# Altium schematic sheet LINREG.SchDoc: Linear Voltage Regulators
size A4; ApprovedBy: LD Stanton; Author: LD Stanton; CompanyName: University of Cape Town; DrawnBy: Lawrence Stanton; Engineer: Lawrence Stanton; Organization: University of Cape Town; Address1: Department of Electrical Engineering; Address2: Rondebosch; Address3: Cape Town; Address4: South Africa 7701; DocumentNumber: 4; SheetNumber: 4; SheetTotal: 14
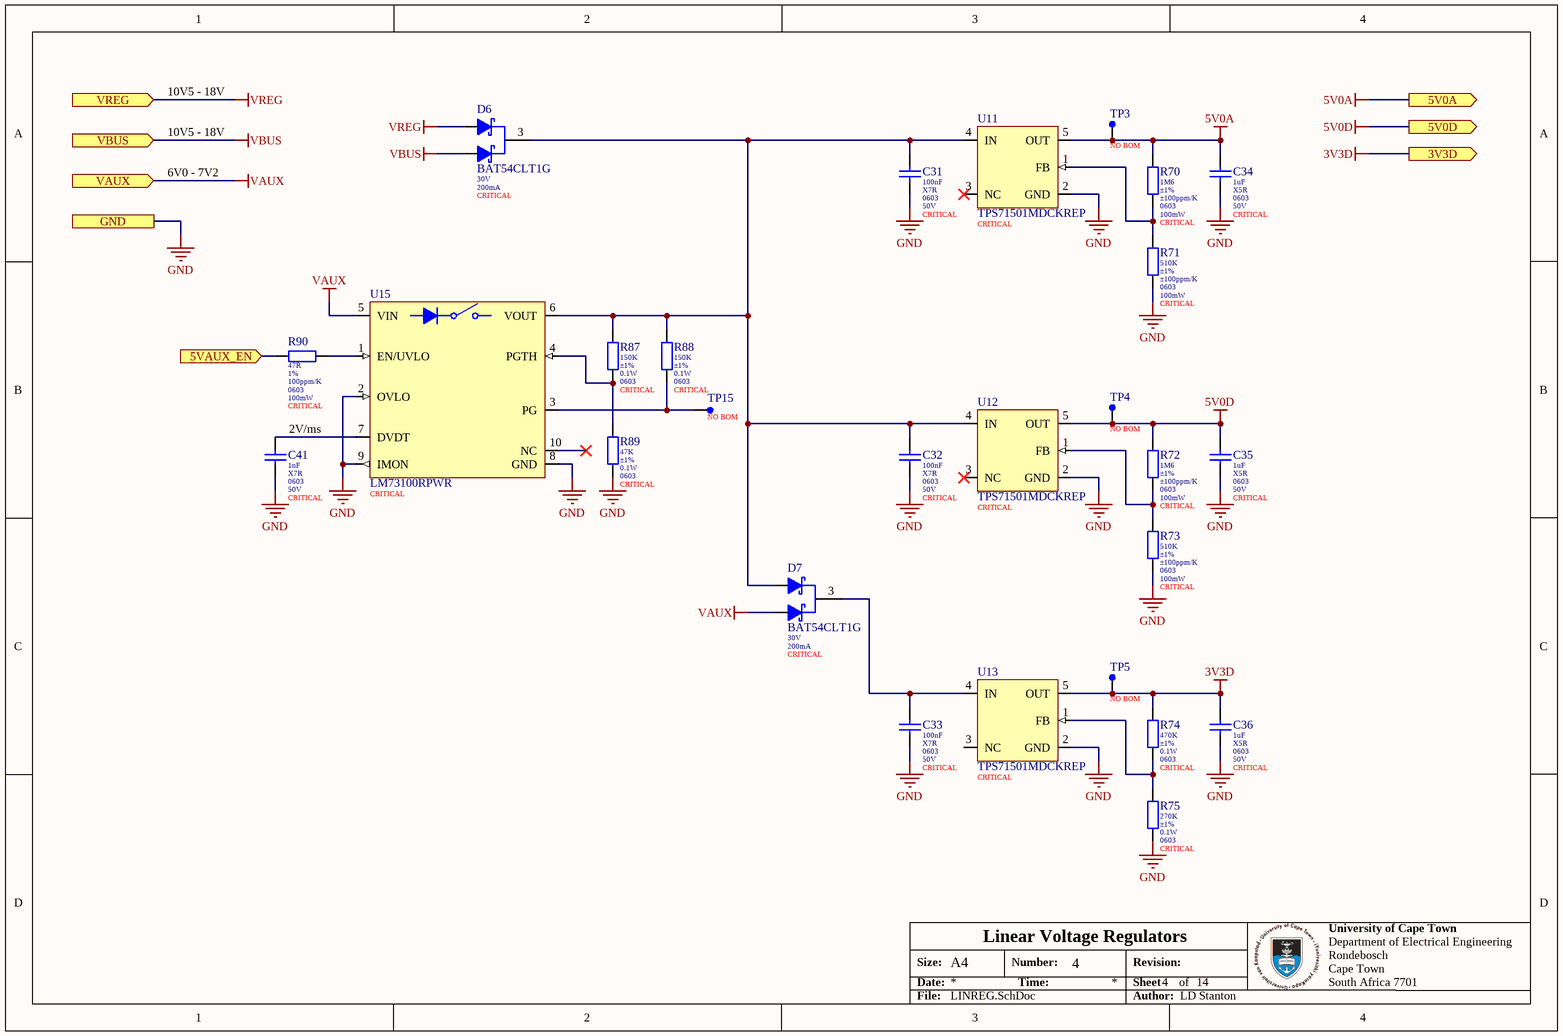
[diagram p0: LINREG.SchDoc]

## Parts
C31  value 100nF  Dielectric: X7R  Package: 0603  Voltage: 50V  Populate: CRITICAL  [0603 (Yageo DA) B]  (hidden comment: CC0603KRX7R9BB104)
C32  value 100nF  Dielectric: X7R  Package: 0603  Voltage: 50V  Populate: CRITICAL  [0603 (Yageo DA) B]  (hidden comment: CC0603KRX7R9BB104)
C33  value 100nF  Dielectric: X7R  Package: 0603  Voltage: 50V  Populate: CRITICAL  [0603 (Yageo DA) B]  (hidden comment: CC0603KRX7R9BB104)
C34  value 1uF  Dielectric: X5R  Package: 0603  Voltage: 50V  Populate: CRITICAL  [0603_080_8 (Samsung) B]  (hidden comment: CL10A105KB8NNNC)
C35  value 1uF  Dielectric: X5R  Package: 0603  Voltage: 50V  Populate: CRITICAL  [0603_080_8 (Samsung) B]  (hidden comment: CL10A105KB8NNNC)
C36  value 1uF  Dielectric: X5R  Package: 0603  Voltage: 50V  Populate: CRITICAL  [0603_080_8 (Samsung) B]  (hidden comment: CL10A105KB8NNNC)
C41  value 1nF  Dielectric: X7R  Package: 0603  Voltage: 50V  Populate: CRITICAL  [0603_080_8 (Samsung) B]  (hidden comment: CL10B102KB8NNNC)
D6  BAT54CLT1G  Reverse Voltage: 30V  Forward Current: 200mA  Placement: CRITICAL  [SOT-23 (BAT45CL) A]
D7  BAT54CLT1G  Reverse Voltage: 30V  Forward Current: 200mA  Placement: CRITICAL  [SOT-23 (BAT45CL) A]
R70  value 1M6  Tolerance: ±1%  Temperature Coefficient: ±100ppm/K  Package: 0603  Power: 100mW  Populate: CRITICAL  [0603 (Uniroyal) B]  (hidden comment: 0603WAF1604T5E)
R71  value 510K  Tolerance: ±1%  Temperature Coefficient: ±100ppm/K  Package: 0603  Power: 100mW  Populate: CRITICAL  [0603 (Uniroyal) B]  (hidden comment: 0603WAF5103T5E)
R72  value 1M6  Tolerance: ±1%  Temperature Coefficient: ±100ppm/K  Package: 0603  Power: 100mW  Populate: CRITICAL  [0603 (Uniroyal) B]  (hidden comment: 0603WAF1604T5E)
R73  value 510K  Tolerance: ±1%  Temperature Coefficient: ±100ppm/K  Package: 0603  Power: 100mW  Populate: CRITICAL  [0603 (Uniroyal) B]  (hidden comment: 0603WAF5103T5E)
R74  value 470K  Tolerance: ±1%  Power: 0.1W  Package: 0603  Populate: CRITICAL  [0603 (Uniroyal) B]  (hidden comment: 0603WAF4703T5E)
R75  value 270K  Tolerance: ±1%  Power: 0.1W  Package: 0603  Populate: CRITICAL  [0603 (Uniroyal) B]  (hidden comment: 0603WAF2703T5E)
R87  value 150K  Tolerance: ±1%  Power: 0.1W  Package: 0603  Populate: CRITICAL  [0603 (Uniroyal) B]  (hidden comment: 0603WAF1503T5E)
R88  value 150K  Tolerance: ±1%  Power: 0.1W  Package: 0603  Populate: CRITICAL  [0603 (Uniroyal) B]  (hidden comment: 0603WAF1503T5E)
R89  value 47K  Tolerance: ±1%  Power: 0.1W  Package: 0603  Populate: CRITICAL  [0603 (Uniroyal) B]  (hidden comment: 0603WAF4702T5E)
R90  value 47R  Tolerance: 1%  Temperature Coefficient: 100ppm/K  Package: 0603  Power: 100mW  Populate: CRITICAL  [0603 (Uniroyal) B]  (hidden comment: 0603WAF470JT5E)
TP3  Placement: NO BOM  [Test Point Pad 1.0mm]  (hidden comment: Test Point)  (no BOM)
TP4  Placement: NO BOM  [Test Point Pad 1.0mm]  (hidden comment: Test Point)  (no BOM)
TP5  Placement: NO BOM  [Test Point Pad 1.0mm]  (hidden comment: Test Point)  (no BOM)
TP15  Placement: NO BOM  [Test Point Pad 0.6mm]  (hidden comment: Test Point)  (no BOM)
U11  TPS71501MDCKREP  Placement: CRITICAL  [SOT-5 (DCK0005A) A]
U12  TPS71501MDCKREP  Placement: CRITICAL  [SOT-5 (DCK0005A) A]
U13  TPS71501MDCKREP  Placement: CRITICAL  [SOT-5 (DCK0005A) A]
U15  LM73100RPWR  Placement: CRITICAL  [VQFN-10 (LM73100) MFG]

## Ports
3V3D (out), 5V0A (out), 5V0D (out), 5VAUX_EN (in), GND, VAUX (in), VBUS (in), VREG (in)

## Nets
3V3D: C36.1 R74.1 TP5.1 U13.5(OUT) ; port 3V3D
5V0A: C34.1 R70.1 TP3.1 U11.5(OUT) ; port 5V0A
5V0D: C35.1 R72.1 TP4.1 U12.5(OUT) ; port 5V0D
GND: C31.2 C32.2 C33.2 C34.2 C35.2 C36.2 C41.2 R71.2 R73.2 R75.2 R89.2 U11.2(GND) U12.2(GND) U13.2(GND) U15.2(OVLO) U15.8(GND) U15.9(IMON) ; port GND
VAUX: D7.1(A1) U15.5(VIN) ; port VAUX
VBUS: D6.1(A1) ; port VBUS
VREG: D6.2(A2) ; port VREG
5VAUX_EN: R90.1 ; port 5VAUX_EN
NetC31_1: C31.1 C32.1 D6.3(K) D7.2(A2) R87.1 R88.1 U11.4(IN) U12.4(IN) U15.6(VOUT)
NetC33_1: C33.1 D7.3(K) U13.4(IN)
NetC41_1: C41.1 U15.7(DVDT)
NetR70_2: R70.2 R71.1 U11.1(FB)
NetR72_2: R72.2 R73.1 U12.1(FB)
NetR74_2: R74.2 R75.1 U13.1(FB)
NetR87_2: R87.2 R89.1 U15.4(PGTH)
NetR88_2: R88.2 TP15.1 U15.3(PG)
NetR90_2: R90.2 U15.1(EN/UVLO)

Not connected (* = marked no-connect by the designer): U11 3(NC)*; U12 3(NC)*; U13 3(NC); U15 10(NC)*

## Notes on the sheet
- 10V5 - 18V
- 6V0 - 7V2
- (near C41) 2V/ms
- Size:
- Date:
- A4
- Number:
- Time:
- Revision:
- Sheet
- of
- File:
- Author:

## Library data of the parts
C31-C33 = CMP-047-000000-9: MLCC 100nF 50V 0603 X7R ±10%; Manufacturer: Yageo; Tolerance: ±10%; ComponentLink1Description: Datasheet; ComponentLink1URL: https://datasheet.lcsc.com/szlcsc/YAGEO-CC0603KRX7R9BB104_C14663.pdf; LCSC Part Number: C14663
C34-C36 = CMP-045-000002-11: MLCC 1uF 0603 50V X5R ±10%; Manufacturer: Samsung; ComponentLink1URL: https://datasheet.lcsc.com/szlcsc/Samsung-Electro-Mechanics-CL05C100JB5NNNC_C32949.pdf; ComponentLink1Description: Datasheet; Tolerance: ±10%; LCSC Part Number: C15849
C41 = CMP-045-000000-10: MLCC 1nF 0603 50V X7R ±10%; Manufacturer: Samsung; ComponentLink1URL: https://datasheet.lcsc.com/szlcsc/Samsung-Electro-Mechanics-CL05C100JB5NNNC_C32949.pdf; Tolerance: ±10%; ComponentLink1Description: Datasheet; LCSC Part Number: C1588
D6 D7 = CMP-022-000003-4: Schottky Barrier Diode Common Cathode 30V 200mA ON Semi; ComponentLink1Description: Datasheet; LCSC Part Number: C14308; ComponentLink1URL: https://datasheet.lcsc.com/szlcsc/ON-Semicon-ON-SBAT54CLT1G_C124141.pdf
R70 R72 = CMP-00138-2: Resistor 1M6 0603 ±1% Thick Film Uniroyal; Voltage Rating: 75V; Manufacturer: Uniroyal; ComponentLink1Description: Datasheet; ComponentLink1URL: https://datasheet.lcsc.com/szlcsc/1811062009_UNI-ROYAL-Uniroyal-Elec-0603WAF1002T5E_C25804.pdf; Composition: Thick Film; LCSC Part Number: C22770; Max Operating Temperature: 155°C; Min Operating Temperature: -55°C
R71 R73 = CMP-00137-1: Resistor 510K 0603 ±1% Thick Film Uniroyal; Voltage Rating: 75V; Min Operating Temperature: -55°C; ComponentLink1Description: Datasheet; Manufacturer: Uniroyal; LCSC Part Number: C23192; ComponentLink1URL: https://datasheet.lcsc.com/szlcsc/1811062009_UNI-ROYAL-Uniroyal-Elec-0603WAF1002T5E_C25804.pdf; Max Operating Temperature: 155°C; Composition: Thick Film
R74 = CMP-010-000402-2: Resistor 470K 0603 ±1% Thick Film Uniroyal; Temperature Coefficient: ±100ppm/K; Working Voltage: 75V; LCSC Part Number: C23178; Pin Count: 2; Temperature: -55 - 155°C; ComponentLink1Description: Datasheet; Manufacturer: Uniroyal; ComponentLink1URL: https://datasheet.lcsc.com/szlcsc/1811062009_UNI-ROYAL-Uniroyal-Elec-0603WAF1002T5E_C25804.pdf
R75 = CMP-010-000411-2: Resistor 270K 0603 ±1% Thick Film Uniroyal; Temperature Coefficient: ±100ppm/K; Working Voltage: 75V; Pin Count: 2; ComponentLink1Description: Datasheet; Manufacturer: Uniroyal; LCSC Part Number: C22965; ComponentLink1URL: https://datasheet.lcsc.com/szlcsc/1811062009_UNI-ROYAL-Uniroyal-Elec-0603WAF1002T5E_C25804.pdf; Temperature: -55 - 155°C
R87 R88 = CMP-010-000303-9: Resistor 150K 0603 ±1% Thick Film Uniroyal; Temperature Coefficient: ±100ppm/K; Working Voltage: 75V; Manufacturer: Uniroyal; ComponentLink1URL: https://datasheet.lcsc.com/szlcsc/1811062009_UNI-ROYAL-Uniroyal-Elec-0603WAF1002T5E_C25804.pdf; Temperature: -55 - 155°C; LCSC Part Number: C22807; ComponentLink1Description: Datasheet; Pin Count: 2
R89 = CMP-010-000404-2: Resistor 47K 0603 ±1% Thick Film Uniroyal; Temperature Coefficient: ±100ppm/K; Working Voltage: 75V; ComponentLink1Description: Datasheet; LCSC Part Number: C25819; Temperature: -55 - 155°C; Manufacturer: Uniroyal; Pin Count: 2; ComponentLink1URL: https://datasheet.lcsc.com/szlcsc/1811062009_UNI-ROYAL-Uniroyal-Elec-0603WAF1002T5E_C25804.pdf
R90 = CMP-00128-3: Resistor 47R 0603 ±1% Thick Film Uniroyal; Voltage Rating: 75V; ComponentLink1Description: Datasheet; Min Operating Temperature: -55°C; Manufacturer: Uniroyal; ComponentLink1URL: https://datasheet.lcsc.com/szlcsc/1811062009_UNI-ROYAL-Uniroyal-Elec-0603WAF1002T5E_C25804.pdf; Composition: Thick Film; LCSC Part Number: C23182; Max Operating Temperature: 155°C
TP3-TP5 TP15 = CMP-00028-00001-10: Test Point Pad
U11-U13 = CMP-00134-2: Enhanced Product 50 mA, 24 V, 3.2 uA Supply Current, Low Dropout, Linear Regulator; Max Output Current: 50mA; Max Input Voltage: 24V; Dropout Voltage: 415mV; Min Operating Temperature: -55°C; ComponentLink1URL: https://www.ti.com/cn/lit/ds/symlink/tps71501-ep.pdf?ts=1757343311963; LCSC Part Number: C2865892; ComponentLink1Description: Datasheet; Max Operating Temperature: 125°C
U15 = CMP-00143-2: 2.7V~23V 5.5A VQFN-10-HR(2x2) Power Distribution Switches ROHS; Max Supply Voltage: 23V; Min Supply Voltage: 2.7V; LCSC Part Number: C3210761; Min Operating Temperature: -40°C; Max Operating Temperature: 125°C